# Altium schematic sheet 17_HDMI_TX.SchDoc
size A3; SheetNumber: 17; SheetTotal: 21
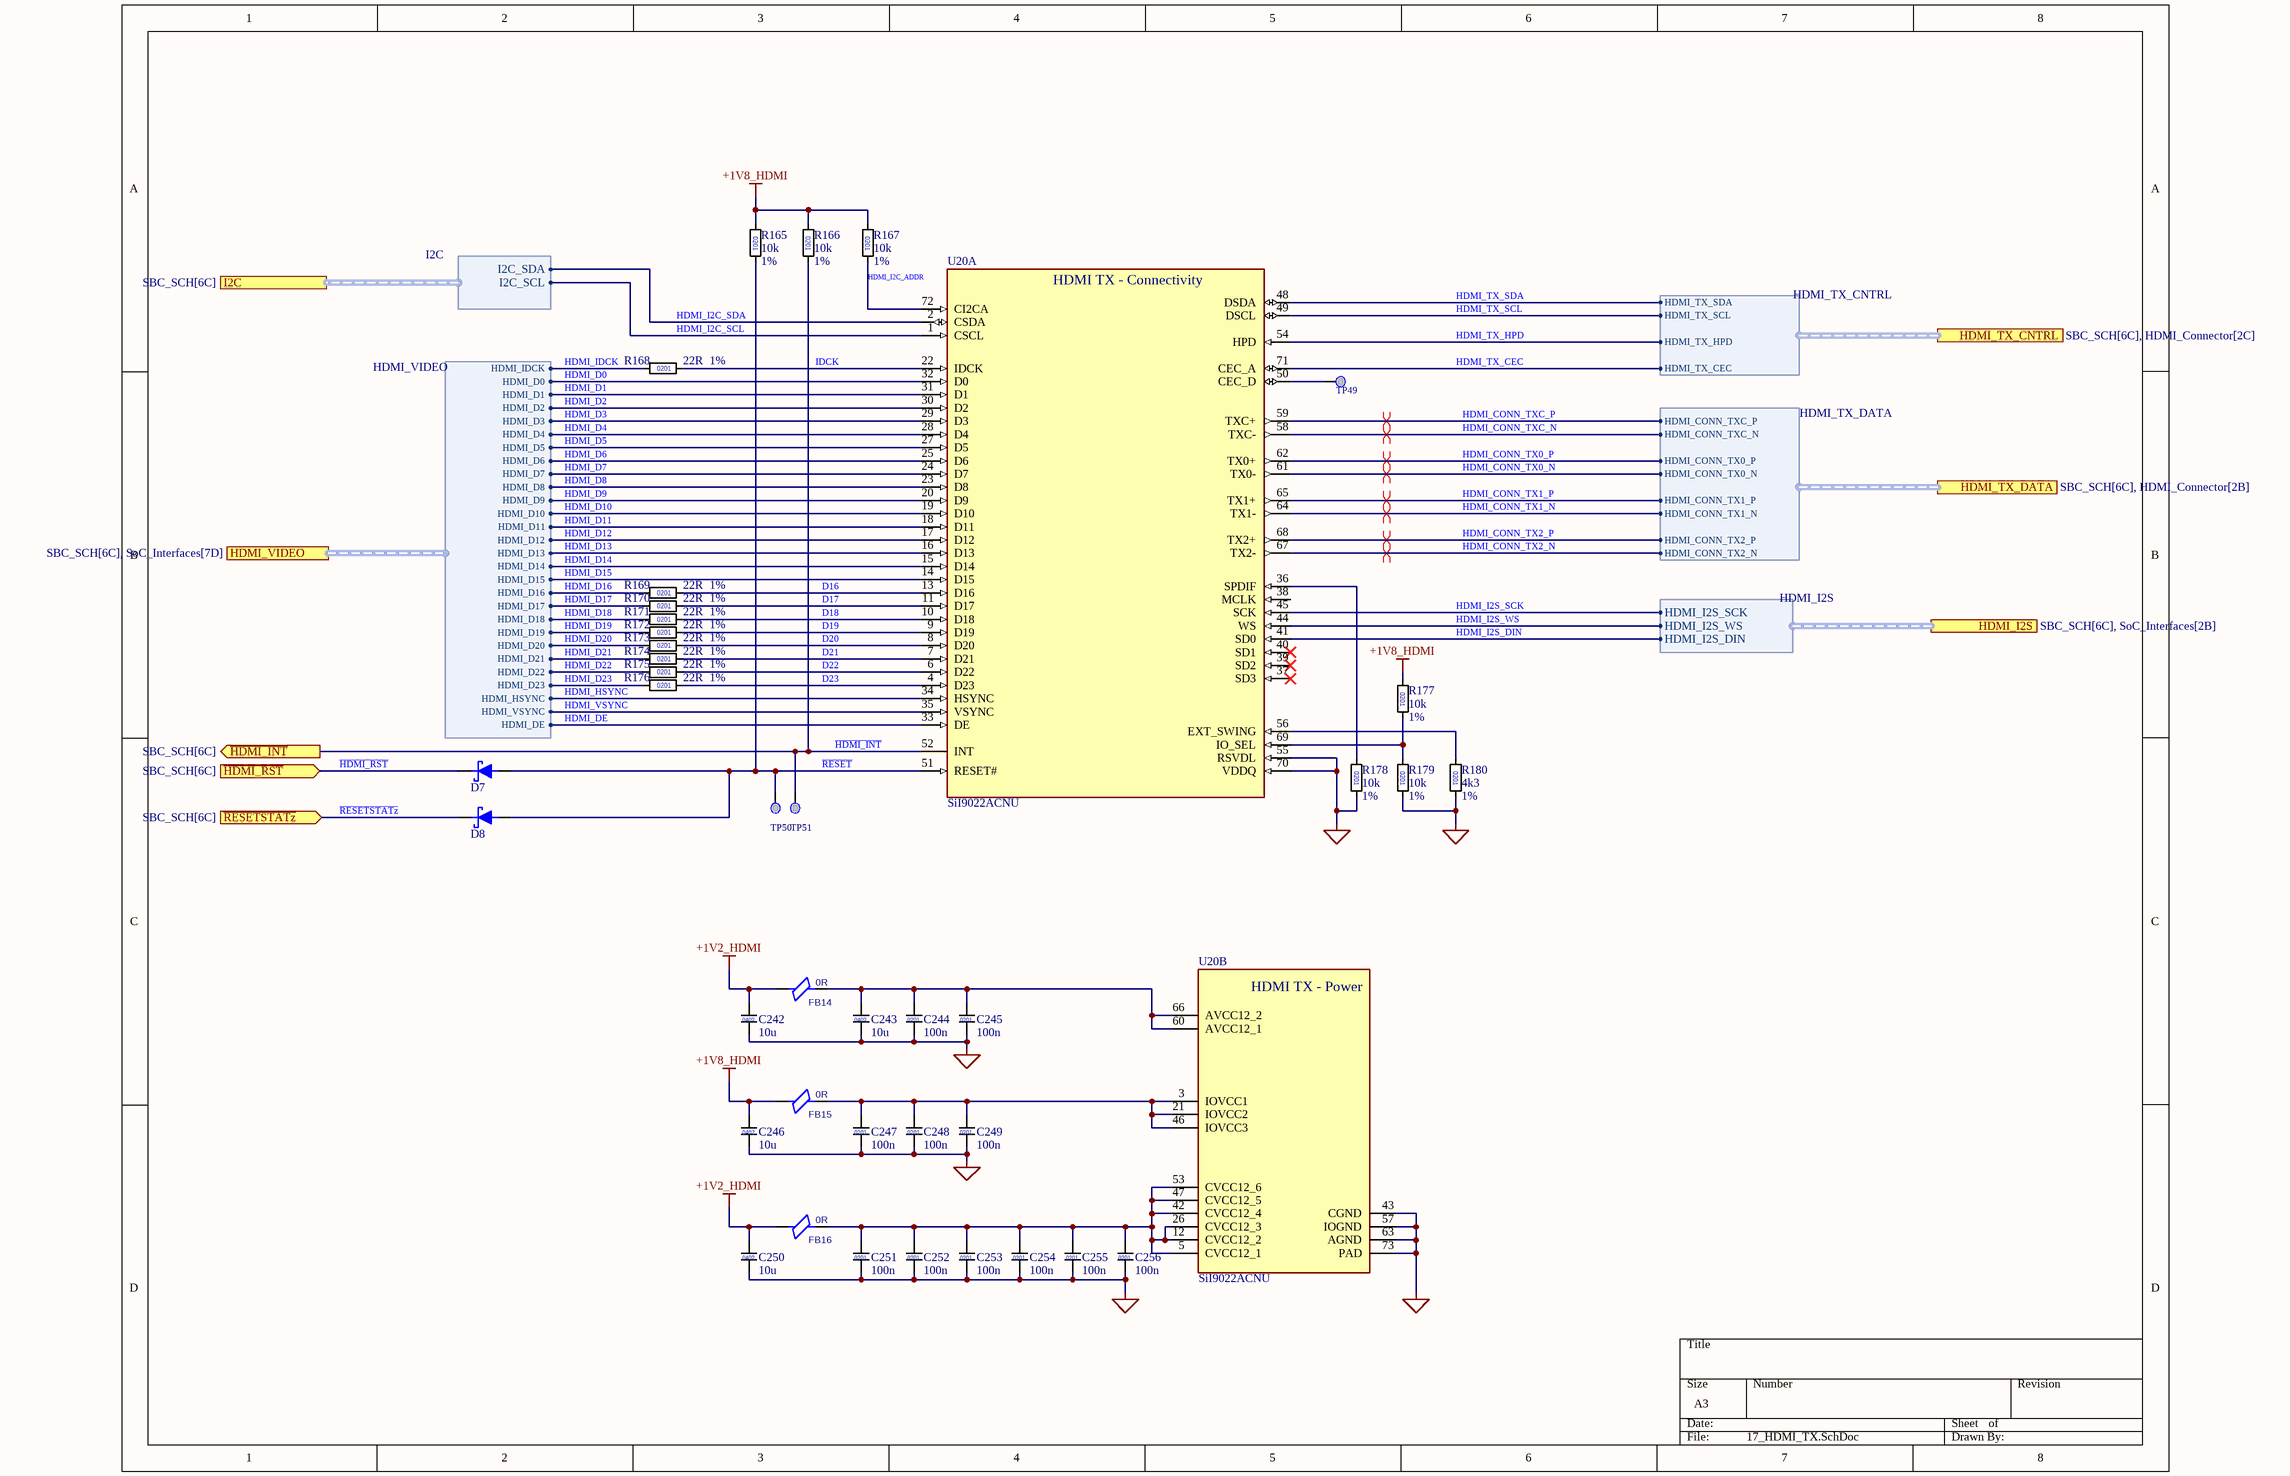
[diagram p0: 17_HDMI_TX.SchDoc]

## Parts
C242  value 10u  [C0402]  (hidden comment: 4u7)
C243  value 10u  [C0402]  (hidden comment: 4u7)
C244  value 100n  [C0201]  (hidden comment: C_0201)
C245  value 100n  [C0201]  (hidden comment: C_0201)
C246  value 10u  [C0402]  (hidden comment: 4u7)
C247  value 100n  [C0201]  (hidden comment: C_0201)
C248  value 100n  [C0201]  (hidden comment: C_0201)
C249  value 100n  [C0201]  (hidden comment: C_0201)
C250  value 10u  [C0402]  (hidden comment: 4u7)
C251  value 100n  [C0201]  (hidden comment: C_0201)
C252  value 100n  [C0201]  (hidden comment: C_0201)
C253  value 100n  [C0201]  (hidden comment: C_0201)
C254  value 100n  [C0201]  (hidden comment: C_0201)
C255  value 100n  [C0201]  (hidden comment: C_0201)
C256  value 100n  [C0201]  (hidden comment: C_0201)
D7  D_Filled  [D_SOD-523]  (value not drawn)
D8  D_Filled  [D_SOD-523]  (value not drawn)
FB14  value 0R  [FB0201]  (hidden comment: FB_0201)
FB15  value 0R  [FB0201]  (hidden comment: FB_0201)
FB16  value 0R  [FB0201]  (hidden comment: FB_0201)
R165  value 10k  Tolerance: 1%  [R0201]  (hidden comment: 0201)
R166  value 10k  Tolerance: 1%  [R0201]  (hidden comment: 0201)
R167  value 10k  Tolerance: 1%  [R0201]  (hidden comment: 0201)
R168  value 22R  Tolerance: 1%  [R0201]  (hidden comment: 0201)
R169  value 22R  Tolerance: 1%  [R0201]  (hidden comment: 0201)
R170  value 22R  Tolerance: 1%  [R0201]  (hidden comment: 0201)
R171  value 22R  Tolerance: 1%  [R0201]  (hidden comment: 0201)
R172  value 22R  Tolerance: 1%  [R0201]  (hidden comment: 0201)
R173  value 22R  Tolerance: 1%  [R0201]  (hidden comment: 0201)
R174  value 22R  Tolerance: 1%  [R0201]  (hidden comment: 0201)
R175  value 22R  Tolerance: 1%  [R0201]  (hidden comment: 0201)
R176  value 22R  Tolerance: 1%  [R0201]  (hidden comment: 0201)
R177  value 10k  Tolerance: 1%  [R0201]  (hidden comment: 0201)
R178  value 10k  Tolerance: 1%  [R0201]  (hidden comment: 0201)
R179  value 10k  Tolerance: 1%  [R0201]  (hidden comment: 0201)
R180  value 4k3  Tolerance: 1%  [R0201]  (hidden comment: 0201)
TP49  Testpoint 0.5mm  [TP_0.50mm]  (value not drawn)  (no BOM)
TP50  Testpoint 0.5mm  [TP_0.50mm]  (value not drawn)  (no BOM)
TP51  Testpoint 0.5mm  [TP_0.50mm]  (value not drawn)  (no BOM)
U20  SiI9022ACNU  [QFN-72-1EP_10x10mm_P0.5mm_EP4.7x4.7mm]  (parts A,B of 2)

## Ports
HDMI_I2S (harness HDMI_I2S, see SBC_SCH[6C], SoC_Interfaces[2B]), HDMI_TX_CNTRL (harness HDMI_TX_CNTRL, see SBC_SCH[6C], HDMI_Connector[2C]), HDMI_TX_DATA (harness HDMI_TX_DATA, see SBC_SCH[6C], HDMI_Connector[2B]), HDMI_VIDEO (harness HDMI_VIDEO, see SBC_SCH[6C], SoC_Interfaces[7D]), I2C (harness I2C, see SBC_SCH[6C]), ~{HDMI_INT} (out, see SBC_SCH[6C]), ~{HDMI_RST} (in, see SBC_SCH[6C]), ~{RESETSTATz} (in, see SBC_SCH[6C])

## Harnesses
HDMI_VIDEO: HDMI_IDCK, HDMI_D0, HDMI_D1, HDMI_D2, HDMI_D3, HDMI_D4, HDMI_D5, HDMI_D6, HDMI_D7, HDMI_D8, HDMI_D9, HDMI_D10, HDMI_D11, HDMI_D12, HDMI_D13, HDMI_D14, HDMI_D15, HDMI_D16, HDMI_D17, HDMI_D18, HDMI_D19, HDMI_D20, HDMI_D21, HDMI_D22, HDMI_D23, HDMI_HSYNC, HDMI_VSYNC, HDMI_DE
HDMI_I2S: HDMI_I2S_SCK, HDMI_I2S_WS, HDMI_I2S_DIN
I2C: I2C_SDA, I2C_SCL
HDMI_TX_DATA: HDMI_CONN_TXC_P, HDMI_CONN_TXC_N, HDMI_CONN_TX0_P, HDMI_CONN_TX0_N, HDMI_CONN_TX1_P, HDMI_CONN_TX1_N, HDMI_CONN_TX2_P, HDMI_CONN_TX2_N
HDMI_TX_CNTRL: HDMI_TX_SDA, HDMI_TX_SCL, HDMI_TX_HPD, HDMI_TX_CEC

## Nets
+1V2_HDMI: C242.1 C250.1 FB14.1 FB16.1
+1V8_HDMI: C246.1 FB15.1 R165.1 R166.1 R167.1 R177.1
GND: C242.2 C243.2 C244.2 C245.2 C246.2 C247.2 C248.2 C249.2 C250.2 C251.2 C252.2 C253.2 C254.2 C255.2 C256.2 R178.2 R179.2 R180.2 U20.43(CGND) U20.55(RSVDL) U20.57(IOGND) U20.63(AGND) U20.70(VDDQ) U20.73(PAD)
~{HDMI_INT}: R166.2 TP51.TP U20.52(INT) ; port ~{HDMI_INT}
~{HDMI_RST}: D7.1(K) ; port ~{HDMI_RST}
~{RESET}: D7.2(A) D8.2(A) R165.2 TP50.TP U20.51(RESET#)
~{RESETSTATz}: D8.1(K) ; port ~{RESETSTATz}
D16: R169.2 U20.13(D16)
D17: R170.2 U20.11(D17)
D18: R171.2 U20.10(D18)
D19: R172.2 U20.9(D19)
D20: R173.2 U20.8(D20)
D21: R174.2 U20.7(D21)
D22: R175.2 U20.6(D22)
D23: R176.2 U20.4(D23)
HDMI_CONN_TX0_N: U20.61(TX0-) ; port HDMI_TX_DATA.HDMI_CONN_TX0_N
HDMI_CONN_TX0_P: U20.62(TX0+) ; port HDMI_TX_DATA.HDMI_CONN_TX0_P
HDMI_CONN_TX1_N: U20.64(TX1-) ; port HDMI_TX_DATA.HDMI_CONN_TX1_N
HDMI_CONN_TX1_P: U20.65(TX1+) ; port HDMI_TX_DATA.HDMI_CONN_TX1_P
HDMI_CONN_TX2_N: U20.67(TX2-) ; port HDMI_TX_DATA.HDMI_CONN_TX2_N
HDMI_CONN_TX2_P: U20.68(TX2+) ; port HDMI_TX_DATA.HDMI_CONN_TX2_P
HDMI_CONN_TXC_N: U20.58(TXC-) ; port HDMI_TX_DATA.HDMI_CONN_TXC_N
HDMI_CONN_TXC_P: U20.59(TXC+) ; port HDMI_TX_DATA.HDMI_CONN_TXC_P
HDMI_D0: U20.32(D0) ; port HDMI_VIDEO.HDMI_D0
HDMI_D1: U20.31(D1) ; port HDMI_VIDEO.HDMI_D1
HDMI_D2: U20.30(D2) ; port HDMI_VIDEO.HDMI_D2
HDMI_D3: U20.29(D3) ; port HDMI_VIDEO.HDMI_D3
HDMI_D4: U20.28(D4) ; port HDMI_VIDEO.HDMI_D4
HDMI_D5: U20.27(D5) ; port HDMI_VIDEO.HDMI_D5
HDMI_D6: U20.25(D6) ; port HDMI_VIDEO.HDMI_D6
HDMI_D7: U20.24(D7) ; port HDMI_VIDEO.HDMI_D7
HDMI_D8: U20.23(D8) ; port HDMI_VIDEO.HDMI_D8
HDMI_D9: U20.20(D9) ; port HDMI_VIDEO.HDMI_D9
HDMI_D10: U20.19(D10) ; port HDMI_VIDEO.HDMI_D10
HDMI_D11: U20.18(D11) ; port HDMI_VIDEO.HDMI_D11
HDMI_D12: U20.17(D12) ; port HDMI_VIDEO.HDMI_D12
HDMI_D13: U20.16(D13) ; port HDMI_VIDEO.HDMI_D13
HDMI_D14: U20.15(D14) ; port HDMI_VIDEO.HDMI_D14
HDMI_D15: U20.14(D15) ; port HDMI_VIDEO.HDMI_D15
HDMI_D16: R169.1 ; port HDMI_VIDEO.HDMI_D16
HDMI_D17: R170.1 ; port HDMI_VIDEO.HDMI_D17
HDMI_D18: R171.1 ; port HDMI_VIDEO.HDMI_D18
HDMI_D19: R172.1 ; port HDMI_VIDEO.HDMI_D19
HDMI_D20: R173.1 ; port HDMI_VIDEO.HDMI_D20
HDMI_D21: R174.1 ; port HDMI_VIDEO.HDMI_D21
HDMI_D22: R175.1 ; port HDMI_VIDEO.HDMI_D22
HDMI_D23: R176.1 ; port HDMI_VIDEO.HDMI_D23
HDMI_DE: U20.33(DE) ; port HDMI_VIDEO.HDMI_DE
HDMI_HSYNC: U20.34(HSYNC) ; port HDMI_VIDEO.HDMI_HSYNC
HDMI_I2C_ADDR: R167.2 U20.72(CI2CA)
HDMI_I2C_SCL: U20.1(CSCL) ; port I2C.I2C_SCL
HDMI_I2C_SDA: U20.2(CSDA) ; port I2C.I2C_SDA
HDMI_I2S_DIN: U20.41(SD0) ; port HDMI_I2S.HDMI_I2S_DIN
HDMI_I2S_SCK: U20.45(SCK) ; port HDMI_I2S.HDMI_I2S_SCK
HDMI_I2S_WS: U20.44(WS) ; port HDMI_I2S.HDMI_I2S_WS
HDMI_IDCK: R168.1 ; port HDMI_VIDEO.HDMI_IDCK
HDMI_TX_CEC: U20.71(CEC_A) ; port HDMI_TX_CNTRL.HDMI_TX_CEC
HDMI_TX_HPD: U20.54(HPD) ; port HDMI_TX_CNTRL.HDMI_TX_HPD
HDMI_TX_SCL: U20.49(DSCL) ; port HDMI_TX_CNTRL.HDMI_TX_SCL
HDMI_TX_SDA: U20.48(DSDA) ; port HDMI_TX_CNTRL.HDMI_TX_SDA
HDMI_VSYNC: U20.35(VSYNC) ; port HDMI_VIDEO.HDMI_VSYNC
IDCK: R168.2 U20.22(IDCK)
NetC243_1: C243.1 C244.1 C245.1 FB14.2 U20.60(AVCC12_1) U20.66(AVCC12_2)
NetC247_1: C247.1 C248.1 C249.1 FB15.2 U20.3(IOVCC1) U20.21(IOVCC2) U20.46(IOVCC3)
NetC251_1: C251.1 C252.1 C253.1 C254.1 C255.1 C256.1 FB16.2 U20.5(CVCC12_1) U20.12(CVCC12_2) U20.26(CVCC12_3) U20.42(CVCC12_4) U20.47(CVCC12_5) U20.53(CVCC12_6)
NetR177_2: R177.2 R179.1 U20.69(IO_SEL)
NetR178_1: R178.1 U20.36(SPDIF)
NetR180_1: R180.1 U20.56(EXT_SWING)
NetTP49_TP: TP49.TP U20.50(CEC_D)

Not connected (* = marked no-connect by the designer): U20 37(SD3)* 38(MCLK) 39(SD2)* 40(SD1)*

## Layout directives
differential pair: HDMI_CONN_TX0_N, HDMI_CONN_TX0_P, HDMI_CONN_TX1_N, HDMI_CONN_TX1_P, HDMI_CONN_TX2_N, HDMI_CONN_TX2_P, HDMI_CONN_TXC_N, HDMI_CONN_TXC_P

## Notes on the sheet
- (in symbol C_0201) 0201
- (in symbol C_0402) 0402
- (in symbol SiI9022ACNU, part A) HDMI TX - Connectivity
- (in symbol SiI9022ACNU, part B) HDMI TX - Power

## Library data of the parts
C242 C243 C246 C250 = C_0402: MLCC 0402; Manufacturer_Name: *; Manufacturer_Part_Number: *
C244 C245 C247-C249 C251-C256 = C_0201: MLCC 0201; Manufacturer_Name: *; Manufacturer_Part_Number: *
D7 D8 = D_Filled: Diode, filled shape; Manufacturer_Name: Panjit International Inc.; Value: BAT54TS_R1_00001; Manufacturer Part Number: BAT54TS_R1_00001
FB14-FB16 = FB_0201: Ferrite bead; Parameter 1: *
R165-R180 = R_0201: Manufacturer_Name: *; Manufacturer_Part_Number: *
U20 = SiI9022ACNU: HDMI 1.4 transmitter with 24-bit parallel video; Manufacturer_Name: Lattice; Manufacturer_Part_Number: SiI9022ACNU; Value: SiI9022ACNU